# Altium schematic sheet 100_ESP32.SchDoc: MACETA INTELIGENTE
size A4; DrawnBy: ALEXIS VALENCIA; SheetNumber: 3; SheetTotal: 4
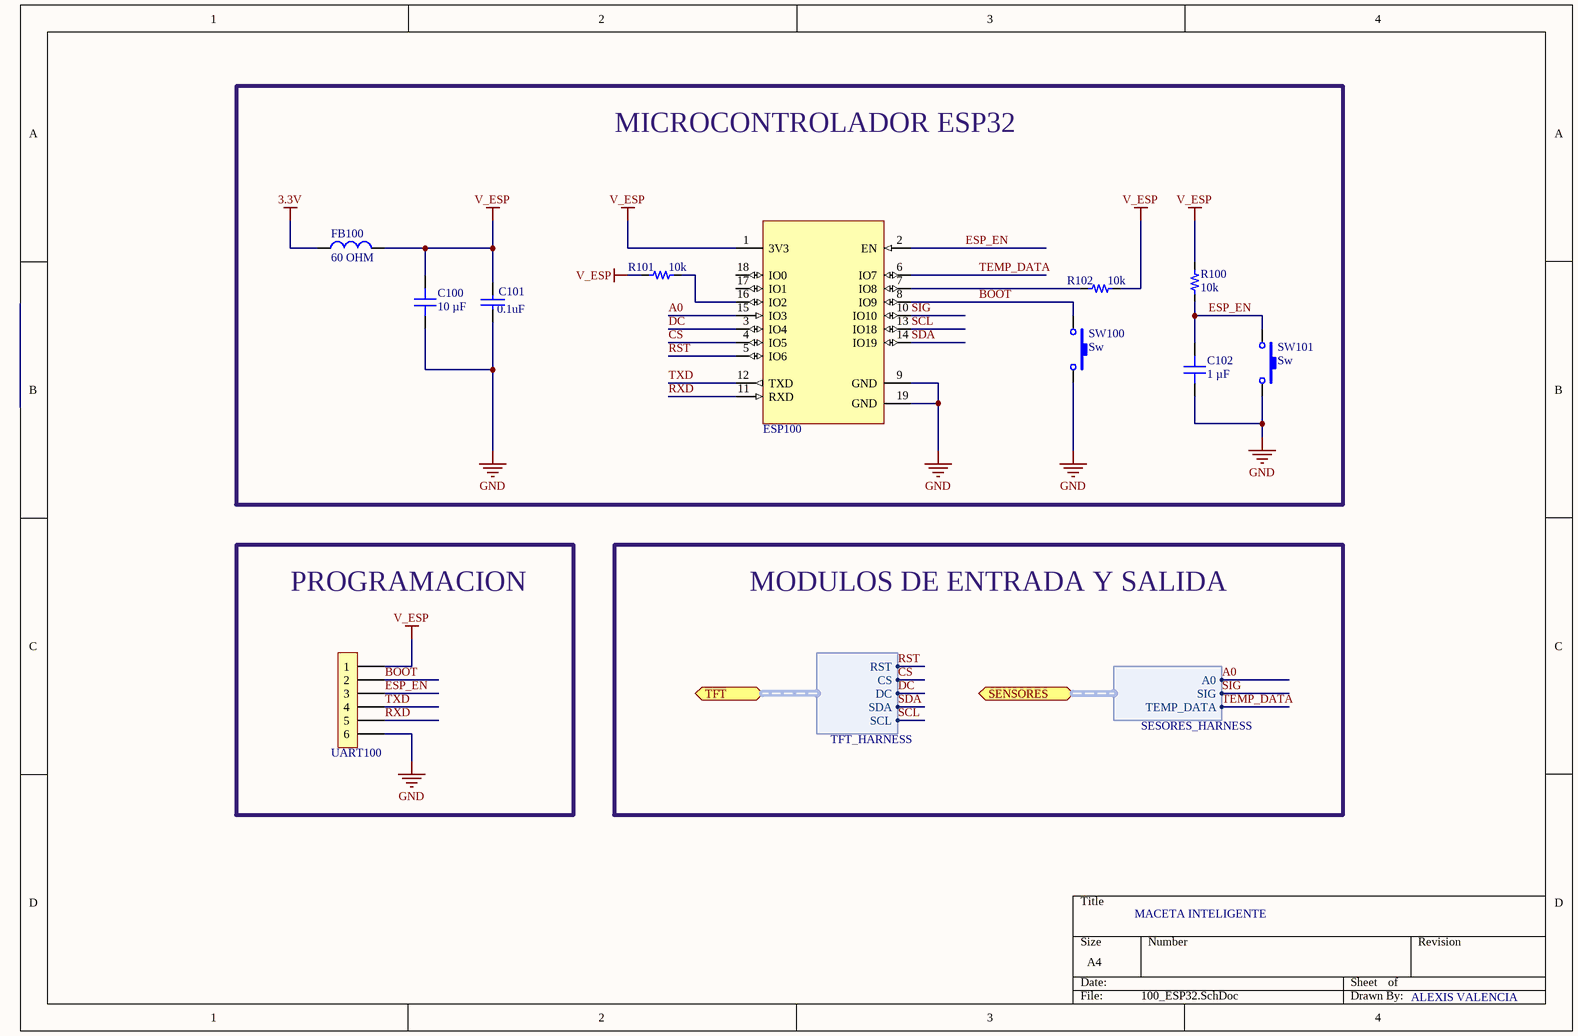
[diagram p0: 100_ESP32.SchDoc]

## Parts
C100  10 µF  [CAP 0603_1608]
C101  value 0.1uF  [0603_cap]  (hidden comment: 0.1uF 50V)
C102  1 µF  [CAP 0603_1608]
ESP100  ESP32-C3-WROOM-02-N4  [ESP32-C3-WROOM-02-N4]  (value not drawn)
FB100  value 60 OHM  [0603_fb]  (hidden comment: 60OHM 2A)
R100  value 10k  [0603_res]  (hidden comment: 10k 1/10W)
R101  value 10k  [0603_res]  (hidden comment: 10k 1/10W)
R102  value 10k  [0603_res]  (hidden comment: 10k 1/10W)
SW100  Sw  [Sw_PUSH_4.5x4.5x5mm]
SW101  Sw  [Sw_PUSH_4.5x4.5x5mm]
UART100  6x1  [H_6x1_TH_100mil]  (value not drawn)  (no BOM)

## Blocks framed on the sheet
MICROCONTROLADOR ESP32: C100-C102 ESP100 FB100 R100-R102 SW100 SW101
PROGRAMACION: UART100

## Ports
SENSORES (bidir, harness SESORES_HARNESS), TFT (bidir, harness TFT_HARNESS)

## Harnesses
TFT_HARNESS: RST, CS, DC, SDA, SCL
SESORES_HARNESS: A0, SIG, TEMP_DATA

## Nets
3.3V: FB100.1
GND: C100.1 C101.2 C102.1 ESP100.9(GND) ESP100.19(GND) SW100.2 SW101.2 UART100.6
V_ESP: C100.2 C101.1 ESP100.1(3V3) FB100.2 R100.2 R101.1 R102.2 UART100.1
A0: ESP100.15(IO3) ; port SENSORES.A0
BOOT: ESP100.8(IO9) SW100.1 UART100.2
CS: ESP100.4(IO5) ; port TFT.CS
DC: ESP100.3(IO4) ; port TFT.DC
ESP_EN: C102.2 ESP100.2(EN) R100.1 SW101.1 UART100.3
RST: ESP100.5(IO6) ; port TFT.RST
RXD: ESP100.11(RXD) UART100.5
SCL: ESP100.13(IO18) ; port TFT.SCL
SDA: ESP100.14(IO19) ; port TFT.SDA
SIG: ESP100.10(IO10) ; port SENSORES.SIG
TEMP_DATA: ESP100.6(IO7) ; port SENSORES.TEMP_DATA
TXD: ESP100.12(TXD) UART100.4
NetESP100_7: ESP100.7(IO8) R102.1
NetESP100_16: ESP100.16(IO2) R101.2

Not connected (* = marked no-connect by the designer): ESP100 17(IO1) 18(IO0)

## Notes on the sheet
- MODULOS DE ENTRADA Y SALIDA

## Library data of the parts
C100 = 06033D106KAT2A: CAP CER 10UF 25V X5R 0603; manufacturer: KYOCERA AVX; Tolerance: ±10%; Part Number: 06033D106KAT2A; Capacitance: 10 µF; Applications: General Purpose; componentlink1description: Datasheet; componentlink1url: https://datasheets.kyocera-avx.com/cx5r-KGM.pdf; componentlink2description: DigiKey Link; componentlink2url: https://www.digikey.com/en/products/detail/kyocera-avx/06033D106KAT2A/17866340; Device Package: 0603 (1608 Metric); lastupdated: 6/04/2026 7:18:42 p. m.; Lifecycle Status: Active; Minimum Order: 1; Mounting Type: Surface Mount, MLCC; Operating Temperature: -55°C ~ 85°C; Package / Case: 0603 (1608 Metric); packaging: TapeAndReel; partid: 68623; price: 0.08; series: KGM - X5R; Size / Dimension: 0.063" L x 0.031" W (1.60mm x 0.80mm); Supplier 1: DigiKey; Supplier Part Number 1: 478-KGM15CR51E106KTCT-ND; Temperature Coefficient: X5R; Thickness (Max): 0.039" (1.00mm); value: 10 µF; Voltage - Rated: 25V
C101 = Cap_0.1uF_0603_50V: 50V 100nF Y5V -20%~+80% 0603 Multilayer Ceramic Capacitors MLCC - SMD/SMT ROHS; Manufacturer: Walsin Tech Corp; Manufacturer Part Number: 0603F104Z500CT; Supplier 1: LCSC; Supplier Part Number 1: C83060; ComponentLink1Description: LCSC; ComponentLink1URL: https://www.lcsc.com/product-detail/Multilayer-Ceramic-Capacitors-MLCC-SMD-SMT_Walsin-Tech-Corp-0603F104Z500CT_C83060.html
C102 = 0603B105K250CT: CAP CER 1UF 25V X7R 0603; manufacturer: Walsin Technology Corporation; Tolerance: ±10%; Part Number: 0603B105K250CT; Capacitance: 1 µF; Applications: General Purpose; componentlink1description: Datasheet; componentlink1url: https://www.passivecomponent.com/wp-content/uploads/datasheet/WTC_MLCC_General_Purpose.pdf; componentlink2description: DigiKey Link; componentlink2url: https://www.digikey.com/en/products/detail/walsin-technology-corporation/0603B105K250CT/14836817; Device Package: 0603 (1608 Metric); lastupdated: 6/04/2026 7:22:13 p. m.; Lifecycle Status: Active; Minimum Order: 1; Mounting Type: Surface Mount, MLCC; Operating Temperature: -55°C ~ 125°C; Package / Case: 0603 (1608 Metric); packaging: TapeAndReel; partid: 41189; Part Status: Active; price: 0.01; series: -; Size / Dimension: 0.063" L x 0.031" W (1.60mm x 0.80mm); Supplier 1: DigiKey; Supplier Part Number 1: 1292-0603B105K250CT-ND; Temperature Coefficient: X7R; Thickness (Max): 0.037" (0.95mm); value: 1 µF; Voltage - Rated: 25V
ESP100 = MCU_ESP32-C3-WROOM-02-N4: RF TXRX MOD BT WIFI PCB TH SMD; Manufacturer: Espressif Systems; Manufacturer Part Number: ESP32-C3-WROOM-02-N4; Supplier 1: LCSC; Supplier Part Number 1: C2934560; ComponentLink1Description: LCSC; ComponentLink1URL: https://lcsc.com/product-detail/WiFi-Modules_Espressif-Systems-ESP32-C3-WROOM-02-N4_C2934560.html
FB100 = FB_60_0603_2A: 2A 1 100mΩ 60Ω@100MHz ±25% 0603 Ferrite Beads ROHS; Manufacturer: TAI-TECH; Manufacturer Part Number: HCB1608KF-600T20; ComponentLink1Description: LCSC; ComponentLink1URL: https://www.lcsc.com/product-detail/Ferrite-Beads_TAI-TECH-HCB1608KF-600T20_C369516.html; Supplier 1: LCSC; Supplier Part Number 1: C369516
R100-R102 = Res_10k_0603_1/10W: RES SMD 10k OHM 5% 1/10W 0603; Manufacturer: FOJAN; Manufacturer Part Number: FRC0603J103TS; ComponentLink1URL: https://www.lcsc.com/product-detail/Chip-Resistor-Surface-Mount_FOJAN-FRC0603J103TS_C2930027.html; Supplier 1: LCSC; Supplier Part Number 1: C2930027; ComponentLink1Description: LCSC
SW100 SW101 = Sw_PUSH_4.5x4.5x5.0xmm: SWITCH TACTILE SPST-NO 0.05A 12V; Manufacturer: BZCN; Manufacturer Part Number: TSC015A05026A; Supplier 1: LCSC; Supplier Part Number 1: C2888509; Last modified by: N-A.Potosi; Last modified date: 20190222; ComponentLink1Description: LCSC; ComponentLink1URL: https://www.lcsc.com/product-detail/Tactile-Switches_BZCN-TSC015A05026A_C2888509.html
UART100 = H_Male_6x1_TH_100mil: ComponentLink1Description: LCSC